# EasyEDA Pro project ProPrj_zuizhong2.epro, board PCB1
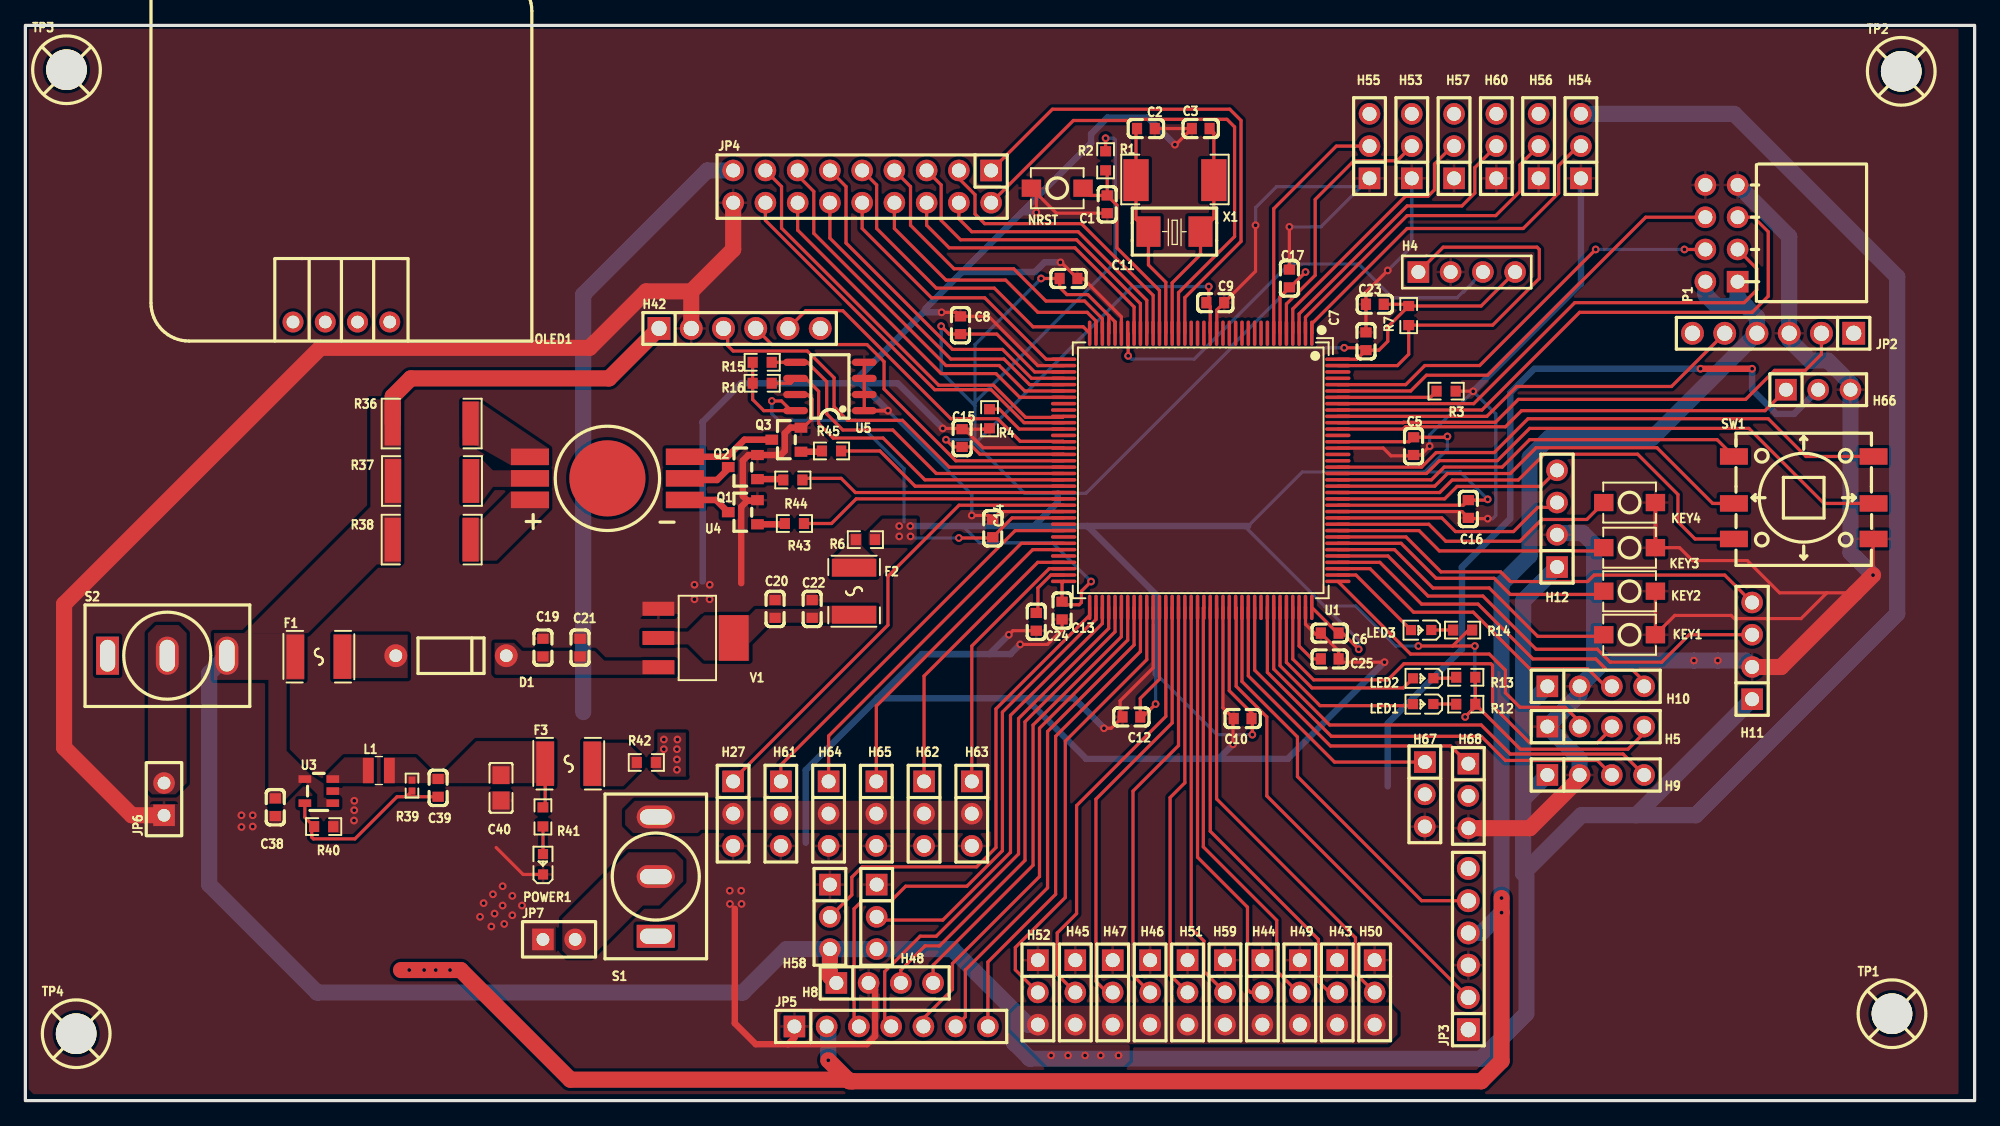
[diagram p1: board, top side]
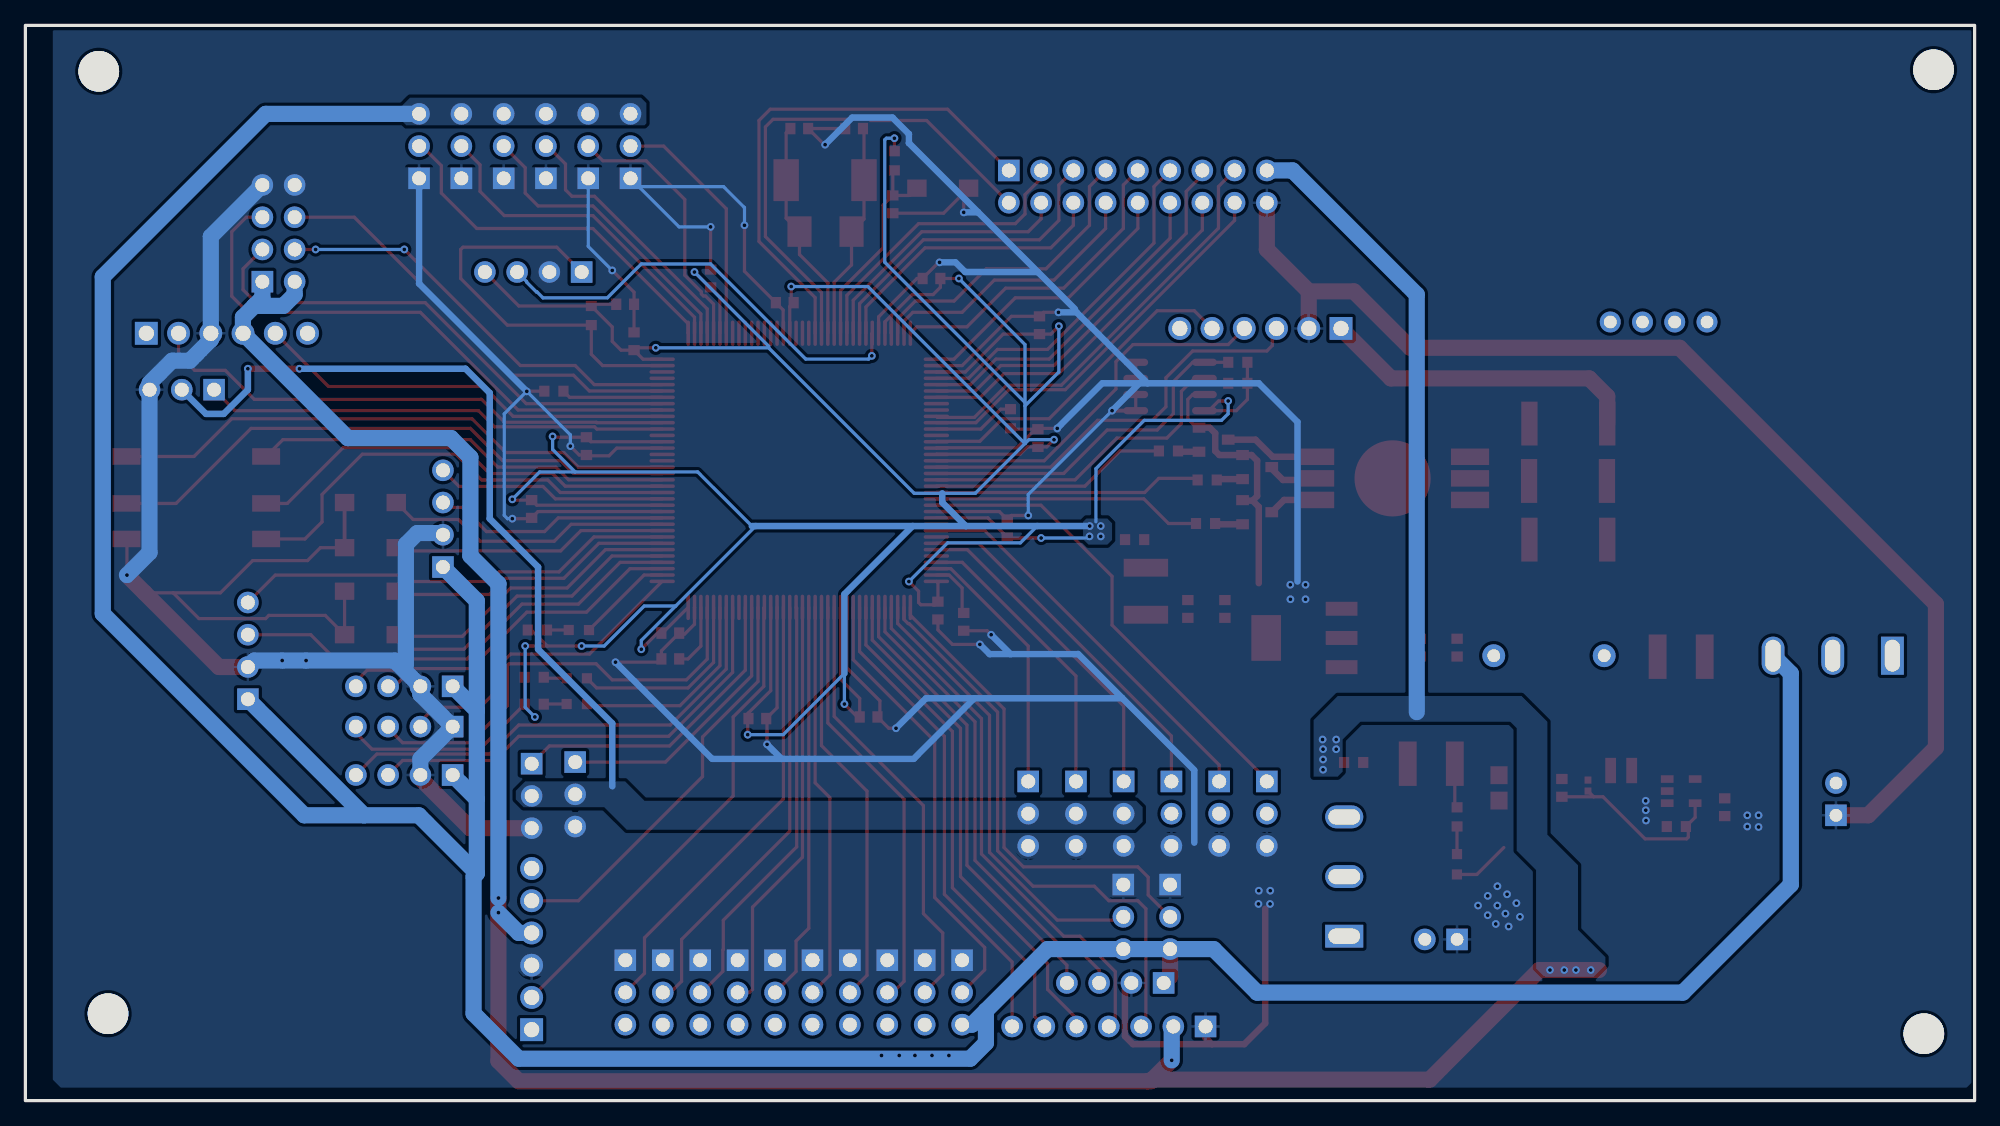
[diagram p2: board, bottom side, seen from below]

Outline 153.54 x 84.71 mm; copper layers: Top Layer, Bottom Layer. Coordinates in mm from the lower left corner of the outline.
Outline path: rectangle 0,84.71 153.54,0
Stack: Top Layer 0.035mm / Dielectric1 1.51mm FR4 er 4.5 / Bottom Layer 0.035mm

## Design rules (mm)
template: JLCPCB Capability(Two Layers Board)
spacing copperThickness1oz (default): track to track 0.102, other pairs 0.152 to 0.3
spacing copperThickness2oz: track to track 0.203, other pairs 0.152 to 0.3
track width copperThickness1oz (default): min 0.127, default 0.254, max 2.54
track width copperThickness2oz: min 0.203, default 0.254, max 2.54
differential pair differentialPair (default): width min 0.127, default 0.254, max 2.54; gap min 0.152, default 0.152
via viaSize (default): diameter min 0.5, default 0.61, max 10; hole min 0.3, default 0.305, max 6.3

## Placement (name value [footprint] x y rotation side)
C1  104  [C0603]  85.22 70.61 90 top
C2  22pF  [C0603]  88.26 76.58 180 top
C3  22pF  [C0603]  92.58 76.58 0 top
C5  104  [C0603]  109.35 51.56 90 top
C6  104  [C0603]  102.74 36.83 0 top
C7  104  [C0603]  105.6 59.82 270 top
C8  104  [C0603]  73.66 61.09 270 top
C9  104  [C0603]  93.73 62.87 180 top
C10  104  [C0603]  95.88 30.1 0 top
C11  104  [C0603]  82.17 64.77 180 top
C12  104  [C0603]  87.12 30.23 0 top
C13  104  [C0603]  81.66 38.61 90 top
C14  104  [C0603]  76.2 45.09 270 top
C15  104  [C0603]  73.79 52.2 270 top
C16  104  [C0603]  113.66 46.61 90 top
C17  104  [C0603]  99.57 64.77 270 top
C19  100nF  [C0603]  40.77 35.69 270 top
C20  100nF  [C0603]  59.06 38.74 270 top
C21  10uF  [C0603]  43.69 35.69 270 top
C22  10uF  [C0603]  61.98 38.74 270 top
C23  104  [C0603]  106.3 62.74 0 top
C24  225  [C0603]  79.63 37.72 90 top
C25  225  [C0603]  102.74 34.8 180 top
C38  10uF  [C0603]  19.69 23.11 90 top
C39  22pF  [C0603]  32.51 24.64 90 top
C40  22uF  [C0805]  37.47 24.64 90 top
D1  -  [DO_1N4007]  33.53 35.05 180 top
F1  FUSE 500mA  [F1812]  23.11 34.97 0 top
F2  FUSE 500mA  [F1812]  65.28 40.13 90 top
F3  FUSE 500mA  [F1812]  42.8 26.54 0 top
H4  PZ254V-11-04P  [HDR-TH_4P-P2.54-V-M-1]  113.54 65.28 0 top
H5  PZ254V-11-04P  [HDR-TH_4P-P2.54-V-M]  123.7 29.46 0 top
H8  PZ254V-11-04P  [HDR-TH_4P-P2.54-V-M]  67.69 9.27 0 top
H9  PZ254V-11-04P  [HDR-TH_4P-P2.54-V-M]  123.7 25.65 0 top
H10  PZ254V-11-04P  [HDR-TH_4P-P2.54-V-M]  123.7 32.64 0 top
H11  PZ254V-11-04P  [HDR-TH_4P-P2.54-V-M]  136.02 35.43 90 top
H12  PZ254V-11-04P  [HDR-TH_4P-P2.54-V-M]  120.65 45.85 90 top
H27  PZ254V-11-03P  [HDR-TH_3P-P2.54-V-M]  55.75 22.61 270 top
H42  PZ254V-11-06P  [HDR-TH_6P-P2.54-V-M-1]  56.26 60.83 0 top
H43  PZ254V-11-03P  [HDR-TH_3P-P2.54-V-M]  103.34 8.52 270 top
H44  PZ254V-11-03P  [HDR-TH_3P-P2.54-V-M]  97.44 8.52 270 top
H45  PZ254V-11-03P  [HDR-TH_3P-P2.54-V-M]  82.7 8.52 270 top
H46  PZ254V-11-03P  [HDR-TH_3P-P2.54-V-M]  88.6 8.52 270 top
H47  PZ254V-11-03P  [HDR-TH_3P-P2.54-V-M]  85.65 8.52 270 top
H48  PZ254V-11-03P  [HDR-TH_3P-P2.54-V-M]  67.06 14.48 270 top
H49  PZ254V-11-03P  [HDR-TH_3P-P2.54-V-M]  100.39 8.52 270 top
H50  PZ254V-11-03P  [HDR-TH_3P-P2.54-V-M]  106.28 8.52 270 top
H51  PZ254V-11-03P  [HDR-TH_3P-P2.54-V-M]  91.54 8.52 270 top
H52  PZ254V-11-03P  [HDR-TH_3P-P2.54-V-M]  79.76 8.52 270 top
H53  PZ254V-11-03P  [HDR-TH_3P-P2.54-V-M]  109.21 75.2 90 top
H54  PZ254V-11-03P  [HDR-TH_3P-P2.54-V-M]  122.53 75.2 90 top
H55  PZ254V-11-03P  [HDR-TH_3P-P2.54-V-M]  105.88 75.2 90 top
H56  PZ254V-11-03P  [HDR-TH_3P-P2.54-V-M]  119.2 75.2 90 top
H57  PZ254V-11-03P  [HDR-TH_3P-P2.54-V-M]  112.54 75.2 90 top
H58  PZ254V-11-03P  [HDR-TH_3P-P2.54-V-M]  63.37 14.48 270 top
H59  PZ254V-11-03P  [HDR-TH_3P-P2.54-V-M]  94.49 8.52 270 top
H60  PZ254V-11-03P  [HDR-TH_3P-P2.54-V-M]  115.87 75.2 90 top
H61  PZ254V-11-03P  [HDR-TH_3P-P2.54-V-M]  59.51 22.61 270 top
H62  PZ254V-11-03P  [HDR-TH_3P-P2.54-V-M]  70.79 22.61 270 top
H63  PZ254V-11-03P  [HDR-TH_3P-P2.54-V-M]  74.55 22.61 270 top
H64  PZ254V-11-03P  [HDR-TH_3P-P2.54-V-M]  63.27 22.61 270 top
H65  PZ254V-11-03P  [HDR-TH_3P-P2.54-V-M]  67.03 22.61 270 top
H66  PZ254V-11-03P  [HDR-TH_3P-P2.54-V-M]  141.22 56.01 0 top
H67  PZ254V-11-03P  [HDR-TH_3P-P2.54-V-M]  110.24 24.13 270 top
H68  PZ254V-11-03P  [HDR-TH_3P-P2.54-V-M]  113.66 24 270 top
JP2  PZ254V-11-06P  [HDR-TH_6P-P2.54-V-M-1]  137.67 60.45 180 top
JP3  PZ254V-11-06P  [HDR-TH_6P-P2.54-V-M-1]  113.66 11.94 90 top
JP4  PZ254V-12-18P  [HDR-TH_18P-P2.54-V-M-R2-C9-S2.54]  65.91 72.01 180 top
JP5  PM254V-11-07-H85  [HDR-TH_7P-P2.54-V-M-1]  68.2 5.84 0 top
JP6  -  [HDR-TH_2P-P2.54-V-F]  10.92 23.75 90 top
JP7  -  [HDR-TH_2P-P2.54-V-F]  42.04 12.7 0 top
KEY1  K2-3.6×6.1_SMD  [Key_SMD_3x4x2]  126.37 36.7 0 top
KEY2  K2-3.6×6.1_SMD  [Key_SMD_3x4x2]  126.37 40.13 0 top
KEY3  K2-3.6×6.1_SMD  [Key_SMD_3x4x2]  126.37 43.56 0 top
KEY4  K2-3.6×6.1_SMD  [Key_SMD_3x4x2]  126.37 47.12 0 top
L1  4.7uH  [IND-SMD_L2.5-W2.0-VLS252012CX-150M]  27.84 26 0 top
LED1  LED-0603_R  [LED0603-RD_WHITE]  110.11 31.24 180 top
LED2  LED-0603_R  [LED0603-RD_WHITE]  110.11 33.27 180 top
LED3  LED-0603_R  [LED0603-RD_WHITE]  109.95 37.07 180 top
NRST  K2-3.6×6.1_SMD  [Key_SMD_3x4x2]  81.28 71.88 180 top
OLED1  -  [0.96OLED_4P]  24.89 61.34 180 top
P1  PM254-2-04-W-8.5  [HDR-TH_8P-P2.54-H-F-R2-C4-W8.5]  133.6 68.33 90 top
POWER1  -  [LED_0603]  40.77 18.67 90 top
Q1  -  [S8050_SOT-23]  56.52 46.23 0 top
Q2  -  [S8050_SOT-23]  56.52 49.78 0 top
Q3  -  [S8050_SOT-23]  59.94 51.94 0 top
R1  1mΩ  [RES-SMD_L6.4-W3.2-R2512]  90.55 72.52 0 top
R2  10kΩ  [R0603_NEW]  85.09 74.04 90 top
R3  10kΩ  [R0603_NEW]  111.91 55.89 180 top
R4  10kΩ  [R0603_NEW]  75.95 53.72 90 top
R6  0Ω  [R0603]  66.17 44.2 0 top
R7  10kΩ  [R0603_NEW]  108.97 61.85 90 top
R12  510Ω  [R0603_NEW]  113.46 31.23 180 top
R13  510Ω  [R0603_NEW]  113.46 33.35 180 top
R14  510Ω  [R0603_NEW]  113.21 37.07 180 top
R15  10kΩ  [R0603_NEW]  58.04 58.17 0 top
R16  10kΩ  [R0603_NEW]  58.04 56.52 0 top
R36  10Ω  [R2512]  32 53.34 0 top
R37  5Ω  [R2512]  32.03 48.82 0 top
R38  5Ω  [R2512]  32 44.2 0 top
R39  453kΩ  [R0402]  30.45 24.82 90 top
R40  100kΩ  [R0603]  23.5 21.59 180 top
R41  1kΩ  [R0603]  40.77 22.35 90 top
R42  0Ω  [R0603]  48.91 26.64 0 top
R43  510Ω  [R0603_NEW]  60.58 45.47 180 top
R44  510Ω  [R0603_NEW]  60.45 48.9 180 top
R45  510Ω  [R0603_NEW]  63.5 51.18 180 top
S1  MT-0-102-A101-M200-RS  [SW-TH_MT-0-103-A101-M200-RS]  49.66 17.65 90 top
S2  MT-0-102-A101-M200-RS  [SW-TH_MT-0-103-A101-M200-RS]  11.18 35.05 0 top
SW1  TM-2027  [SW-SMD_6P-P2.80-L10.2-W10.2]  140.08 47.5 0 top
TP1  -  [M3螺丝]  147.1 6.78 0 top
TP2  -  [M3螺丝]  147.83 81.03 0 top
TP3  -  [M3螺丝]  3.3 81.15 0 top
TP4  -  [M3螺丝]  4.06 5.21 0 top
U1  STM32F407ZGT6 COPY  [LQFP-144_L20.0-W20.0-P0.50-LS22.0-BL]  92.58 49.66 180 top
U3  PW2053  [SOT-23-5_L2.9-W1.6-P0.95-LS2.8-BL]  23.11 24.38 90 top
U4  XL-HD6070RGBC-A46L-BD  [LED-SMD_6P-BD8.0-LS14.5]  45.85 49.02 180 top
U5  24C02/TR  [SOIC-8_L5.0-W4.0-P1.27-LS6.0-BL]  63.37 56.26 90 top
V1  AMS1117-3.3  [SOT-223-3_L6.5-W3.4-P2.30-LS7.0-BR]  52.83 36.45 180 top
X1  8MHz  [OSC-SMD_L5.0-W3.2]  90.52 68.46 0 top

## Footprints (pads in the part's own frame, mm; a bottom-side part is the same pattern mirrored in y, then rotated)
0.96OLED_4P
  round 1.65 hole 1: 1(-3.81,-0.002) 2(-1.27,0.002) 3(1.27,0.002) 4(3.81,0.002)
C0603
  rect 0.8x0.9 smd: 1(-0.7,0) 2(0.7,0)
C0805
  rect 1.41x1.35 smd: 1(-1,0) 2(1,0)
DO_1N4007
  round 1.8 hole 1: 1(-4.35,0) 2(4.35,0)
F1812
  rect 1.407x3.499 smd: 1(-1.853,0) 2(1.853,0)
HDR-TH_2P-P2.54-V-F
  rect 1.7x1.7 hole 1: 1(-1.27,0)
  round 1.7 hole 1: 2(1.27,0)
HDR-TH_3P-P2.54-V-M
  rect 1.7x1.7 hole 1.1: 1(-2.54,0)
  round 1.7 hole 1.1: 2(0,0) 3(2.54,0)
HDR-TH_4P-P2.54-V-M
  rect 1.7x1.7 hole 1.1: 1(-3.81,0)
  round 1.7 hole 1.1: 2(-1.27,0) 3(1.27,0) 4(3.81,0)
HDR-TH_4P-P2.54-V-M-1
  rect 1.7x1.7 hole 1.1: 1(-3.81,0)
  round 1.7 hole 1.1: 2(-1.27,0) 3(1.27,0) 4(3.81,0)
HDR-TH_6P-P2.54-V-M-1
  rect 1.8x1.8 hole 1.2: 1(-6.35,0)
  round 1.8 hole 1.2: 2(-3.81,0) 3(-1.27,0) 4(1.27,0) 5(3.81,0) 6(6.35,0)
HDR-TH_7P-P2.54-V-M-1
  rect 1.7x1.7 hole 1.1: 1(-7.62,0)
  round 1.7 hole 1.1: 2(-5.08,0) 3(-2.54,0) 4(0,0) 5(2.54,0) 6(5.08,0) 7(7.62,0)
HDR-TH_8P-P2.54-H-F-R2-C4-W8.5
  rect 1.7x1.7 hole 1.1: 1(-3.81,-1.27)
  round 1.7 hole 1.1: 2(-3.81,1.27) 3(-1.27,-1.27) 4(-1.27,1.27) 5(1.27,-1.27) 6(1.27,1.27) 7(3.81,-1.27) 8(3.81,1.27)
HDR-TH_18P-P2.54-V-M-R2-C9-S2.54
  rect 1.7x1.7 hole 1.1: 1(-10.16,-1.27)
  round 1.7 hole 1.1: 2(-10.16,1.27) 3(-7.62,-1.27) 4(-7.62,1.27) 5(-5.08,-1.27) 6(-5.08,1.27) 7(-2.54,-1.27) 8(-2.54,1.27) 9(0,-1.27) 10(0,1.27) 11(2.54,-1.27) 12(2.54,1.27) 13(5.08,-1.27) 14(5.08,1.27) 15(7.62,-1.27) 16(7.62,1.27) 17(10.16,-1.27) 18(10.16,1.27)
IND-SMD_L2.5-W2.0-VLS252012CX-150M
  rect 0.85x2 smd: 1(-0.83,0) 2(0.83,0)
Key_SMD_3x4x2
  rect 1.53x1.36 smd: 1(-2.035,0) 2(2.035,0)
LED0603-RD_WHITE
  rect 0.8x0.8 smd: 1(-0.799,-0.004) 2(0.799,0.004)
LED-SMD_6P-BD8.0-LS14.5
  rect 3x1.3 smd: 1(6.1,1.7) 2(-6.1,1.7) 3(6.1,0) 4(-6.1,0) 5(6.1,-1.7) 6(-6.1,-1.7)
  round 6 smd: 7(0,0)
LED_0603
  rect 0.8x0.8 smd: 1(-0.851,-0.01) 2(0.75,-0.005)
LQFP-144_L20.0-W20.0-P0.50-LS22.0-BL
  oval 0.28x2 smd: 1(-8.75,-10.8) 2(-8.25,-10.8) 3(-7.75,-10.8) 4(-7.25,-10.8) 5(-6.75,-10.8) 6(-6.25,-10.8) 7(-5.75,-10.8) 8(-5.25,-10.8) 9(-4.75,-10.8) 10(-4.25,-10.8) 11(-3.75,-10.8) 12(-3.25,-10.8) 13(-2.75,-10.8) 14(-2.25,-10.8) 15(-1.75,-10.8) 16(-1.25,-10.8) 17(-0.75,-10.8) 18(-0.25,-10.8) 19(0.25,-10.8) 20(0.75,-10.8) 21(1.25,-10.8) 22(1.75,-10.8) 23(2.25,-10.8) 24(2.75,-10.8) 25(3.25,-10.8) 26(3.75,-10.8) 27(4.25,-10.8) 28(4.75,-10.8) 29(5.25,-10.8) 30(5.75,-10.8) 31(6.25,-10.8) 32(6.75,-10.8) 33(7.25,-10.8) 34(7.75,-10.8) 35(8.25,-10.8) 36(8.75,-10.8) 73(8.75,10.8) 74(8.25,10.8) 75(7.75,10.8) 76(7.25,10.8) 77(6.75,10.8) 78(6.25,10.8) 79(5.75,10.8) 80(5.25,10.8) 81(4.75,10.8) 82(4.25,10.8) 83(3.75,10.8) 84(3.25,10.8) 85(2.75,10.8) 86(2.25,10.8) 87(1.75,10.8) 88(1.25,10.8) 89(0.75,10.8) 90(0.25,10.8) 91(-0.25,10.8) 92(-0.75,10.8) 93(-1.25,10.8) 94(-1.75,10.8) 95(-2.25,10.8) 96(-2.75,10.8) 97(-3.25,10.8) 98(-3.75,10.8) 99(-4.25,10.8) 100(-4.75,10.8) 101(-5.25,10.8) 102(-5.75,10.8) 103(-6.25,10.8) 104(-6.75,10.8) 105(-7.25,10.8) 106(-7.75,10.8) 107(-8.25,10.8) 108(-8.75,10.8)
  oval 2x0.28 smd: 37(10.8,-8.75) 38(10.8,-8.25) 39(10.8,-7.75) 40(10.8,-7.25) 41(10.8,-6.75) 42(10.8,-6.25) 43(10.8,-5.75) 44(10.8,-5.25) 45(10.8,-4.75) 46(10.8,-4.25) 47(10.8,-3.75) 48(10.8,-3.25) 49(10.8,-2.75) 50(10.8,-2.25) 51(10.8,-1.75) 52(10.8,-1.25) 53(10.8,-0.75) 54(10.8,-0.25) 55(10.8,0.25) 56(10.8,0.75) 57(10.8,1.25) 58(10.8,1.75) 59(10.8,2.25) 60(10.8,2.75) 61(10.8,3.25) 62(10.8,3.75) 63(10.8,4.25) 64(10.8,4.75) 65(10.8,5.25) 66(10.8,5.75) 67(10.8,6.25) 68(10.8,6.75) 69(10.8,7.25) 70(10.8,7.75) 71(10.8,8.25) 72(10.8,8.75) 109(-10.8,8.75) 110(-10.8,8.25) 111(-10.8,7.75) 112(-10.8,7.25) 113(-10.8,6.75) 114(-10.8,6.25) 115(-10.8,5.75) 116(-10.8,5.25) 117(-10.8,4.75) 118(-10.8,4.25) 119(-10.8,3.75) 120(-10.8,3.25) 121(-10.8,2.75) 122(-10.8,2.25) 123(-10.8,1.75) 124(-10.8,1.25) 125(-10.8,0.75) 126(-10.8,0.25) 127(-10.8,-0.25) 128(-10.8,-0.75) 129(-10.8,-1.25) 130(-10.8,-1.75) 131(-10.8,-2.25) 132(-10.8,-2.75) 133(-10.8,-3.25) 134(-10.8,-3.75) 135(-10.8,-4.25) 136(-10.8,-4.75) 137(-10.8,-5.25) 138(-10.8,-5.75) 139(-10.8,-6.25) 140(-10.8,-6.75) 141(-10.8,-7.25) 142(-10.8,-7.75) 143(-10.8,-8.25) 144(-10.8,-8.75)
M3螺丝
  round 3.2 hole 3.2: 1(-0.064,0.064)
OSC-SMD_L5.0-W3.2
  rect 1.9x2.4 smd: 1(-2.05,0) 2(2.05,0)
R0402
  rect 0.566x0.54 smd: 1(-0.433,0) 2(0.433,0)
R0603
  rect 0.806x0.864 smd: 1(-0.753,0) 2(0.753,0)
R0603_NEW
  rect 0.806x0.864 smd: 1(-0.753,0) 2(0.753,0)
R2512
  rect 1.282x3.456 smd: 1(-3.067,0) 2(3.067,0)
RES-SMD_L6.4-W3.2-R2512
  rect 2x3.3 smd: 1(-3.067,0) 2(3.067,0)
S8050_SOT-23
  rect 1x0.8 smd: 1(1.15,-0.823) 2(1.15,1.077) 3(-1.15,0.127)
SOIC-8_L5.0-W4.0-P1.27-LS6.0-BL
  oval 0.569x1.95 smd: 1(-1.905,-2.705) 2(-0.635,-2.705) 3(0.635,-2.705) 4(1.905,-2.705) 5(1.905,2.705) 6(0.635,2.705) 7(-0.635,2.705) 8(-1.905,2.705)
SOT-23-5_L2.9-W1.6-P0.95-LS2.8-BL
  rect 0.6x1 smd: 1(-0.95,-1.1) 2(0,-1.1) 3(0.95,-1.1) 4(0.95,1.1) 5(-0.95,1.1)
SOT-223-3_L6.5-W3.4-P2.30-LS7.0-BR
  rect 2.5x1.1 smd: 1(2.97,-2.3) 2(2.97,0) 3(2.97,2.3)
  rect 2.34x3.6 smd: 4(-2.97,0)
SW-SMD_6P-P2.80-L10.2-W10.2
  rect 2.2x1.3 smd: 1(-5.5,3.25) 2(-5.5,-0.45) 3(-5.5,-3.25) 4(5.5,-3.25) 5(5.5,-0.45) 6(5.5,3.25)
SW-TH_MT-0-103-A101-M200-RS
  rect 1.8x3 hole 1.2x2.5: 1(-4.7,0)
  oval 1.8x3 hole 1.2x2.5: 2(0,0) 3(4.7,0)

## Nets
As in the schematic.

Pads without a net: H42 6; JP2 1 6; JP3 1 6; OLED1 1 2 3 4; S1 1; S2 1; TP1 1; TP2 1; TP3 1; TP4 1; U4 7

## Via types
v1: diameter 0.61, hole 0.305, Top Layer to Bottom Layer, 92 vias

## Routing (per net, layer and track width the routed paths; a pad name or vN(x,y) marks a point on that pad's centre or on a via; arc(x,y) is an arc through that point)
5V: length 313.8
  Top Layer w1.27: R36.1 28.94,55.48 30.35,56.9 45.97,56.9 H42.1 ; H8.1 63.37,9.78 H58.3
  Bottom Layer w1.27: 126.87,22.48 H11.1 ; 126.87,22.48 131.57,22.48 147.45,38.35 147.45,64.9 134.61,77.74 H54.3 ; 126.87,22.48 122.56,22.48 117.98,17.91 ; H12.1 117.98,39.37 117.98,30.73 ; 117.98,17.91 117.98,23.75 ; 117.98,17.91 118.24,17.65 118.24,6.86 114.68,3.3 79.12,3.3 77.88,4.54 77.88,7.08 ; 117.98,23.75 H9.1 ; 117.98,23.75 117.98,30.73 ; S2.3 14.48,33.65 14.48,17.02 22.99,8.51 56.52,8.51 59.94,11.94 H58.3 H48.3 73.03,11.94 77.88,7.08 ; 77.88,7.08 78.98,5.98 H52.3 ; 117.98,30.73 H10.1
  vias: v1(80.8,3.56) v1(82.13,3.56) v1(83.47,3.56) v1(84.71,3.56) v1(86.11,3.56)
GND: length 660
  Top Layer w0.254: U1.83 88.83,34.1 86.23,31.5 86.23,30.42 C12.1 85.53,29.34 v1(84.96,29.34) ; R3.1 114.03,55.89 v1(114.05,55.88) ; 105.6,62.74 105.6,63.69 v1(107.31,65.41) ; R4.1 75.88,52.9 73.98,52.9 75.44,51.44 81.75,51.44 U1.51 ; v1(90.55,75.31) 90.61,75.31 C3.1 88.97,76.58 ; U5.4 U5.3 U5.2 U5.1 ; 79.63,71.5 NRST.2 ; 79.63,71.5 v1(79.63,69.98) ; 79.63,71.5 81.22,69.91 C1.1 ; U1.16 93.85,60.48 93.85,62.29 C9.1 96.9,65.34 v1(96.9,68.96) ; v1(145.54,41.4) 145.54,44.21 SW1.4 ; 105.6,60.52 C23.1 ; Q3.2 61.28,53.02 61.98,53.72 61.98,55.25 61.59,55.63 U5.7 ; C24.1 77.79,37.02 v1(77.47,36.7) ; v1(115.19,45.85) 113.73,45.85 C16.1 113.17,46.41 U1.120 ; 37.08,19.94 39.2,17.82 POWER1.1 ; v1(81.53,66.04) 81.6,66.04 C11.1 83.31,64.77 86.33,61.75 U1.31 ; KEY3.2 130.3,43.56 131.32,42.55 135.64,42.55 138.18,40.01 141.9,40.01 ; v1(99.57,68.83) C17.1 ; 81.66,37.91 81.66,37.08 80.52,35.94 v1(78.36,35.94) ; v1(72.26,52.96) 73.72,52.96 C15.1 ; v1(110.62,51.56) 109.92,50.86 C5.1 109.28,50.8 107.57,50.8 106.96,51.41 U1.130 ; v1(107.06,34.54) 103.7,34.54 C25.1 103.44,35.43 C6.1 101.97,36.76 101.61,36.76 100.84,37.53 100.84,38.85 U1.107 ; v1(95.12,28.07) 95.12,30.04 C10.1 94.33,30.95 U1.94 ; v1(74.55,46.1) 75.88,46.1 C14.1 76.82,46.41 U1.61 ; 141.9,40.01 144.15,40.01 ; 141.9,40.01 139.87,37.97 134.62,37.97 134.37,38.23 129.92,38.23 KEY1.2 KEY2.2 ; U1.38 79.76,57.91 75.88,61.79 C8.1 73.34,62.1 v1(72.17,62.1)
  Top Layer w0.305: v1(67.94,54.36) U5.1 ; KEY4.2 KEY3.2
  Top Layer w0.508: H8.2 66.93,8.76 66.93,5.08 66.29,4.45 60.07,4.45 ; Q1.2 57.63,47.27 56.87,47.27 ; 56.87,47.27 56.39,46.78 56.39,40.77 ; 56.87,47.27 56.52,47.63 56.52,50.42 56.96,50.86 Q2.2 59.5,50.86 59.82,51.18 59.82,52.58 60.26,53.02 Q3.2 ; 60.07,4.45 60.58,4.95 JP5.1 ; 60.07,4.45 57.53,4.45 55.88,6.1 55.88,15.11
  Top Layer w1.27: H42.2 52.45,63.75 ; 52.45,63.75 48.89,63.75 44.45,59.31 23.24,59.31 3.05,39.12 3.05,27.81 8.38,22.48 JP6.1 ; 52.45,63.75 55.75,67.06 JP4.18 ; H9.2 122.43,25.38 118.51,21.46 H68.3 ; H11.2 138.3,34.16 v1(145.54,41.4)
  Bottom Layer w0.254: v1(67.94,54.36) 74.55,47.75 v1(74.55,46.1) ; v1(110.62,51.56) 110.62,52.45 v1(114.05,55.88) 115.82,54.1 115.82,46.1 115.57,45.85 v1(115.19,45.85) ; 105.23,72.01 98.55,72.01 96.9,70.36 v1(96.9,68.96) ; 105.23,72.01 102.05,68.83 v1(99.57,68.83) ; 105.23,72.01 H55.1 ; H53.1 109.21,67.3 v1(107.31,65.41)
  Bottom Layer w0.508: 65.15,56.52 70.74,62.1 v1(72.17,62.1) ; 65.15,56.52 65.79,56.52 ; 65.15,56.52 56.39,56.52 53.34,53.47 53.34,40.89 ; 78.79,31.7 67.13,31.7 ; 78.79,31.7 82.6,31.7 v1(84.96,29.34) ; 78.79,31.7 83.57,26.92 93.98,26.92 ; 67.13,31.7 61.47,26.04 61.47,20.32 ; 67.13,31.7 70.61,35.18 75.95,35.18 ; v1(72.26,52.96) 68.71,56.52 65.79,56.52 ; 93.98,26.92 99.44,26.92 v1(107.06,34.54) ; 93.98,26.92 v1(95.12,28.07) ; 65.79,56.52 v1(67.94,54.36) ; 78.49,69.98 83.95,75.44 83.95,76.16 85.24,77.45 88.41,77.45 v1(90.55,75.31) ; 78.49,69.98 73.79,65.28 ; 78.49,69.98 v1(79.63,69.98) ; 75.95,35.18 v1(77.47,36.7) ; 75.95,35.18 77.6,35.18 v1(78.36,35.94) ; 70.87,62.36 73.79,65.28 ; 73.79,65.28 79.51,65.28 80.27,66.04 v1(81.53,66.04) ; H54.1 122.53,64.37 v1(114.05,55.88)
  Bottom Layer w1.27: v1(145.54,41.4) 143.76,43.18 H66.3 143.76,56.52 141.99,58.29 140.59,58.29 138.94,59.94 JP2.3 138.94,68.07 P1.7 ; 123.57,34.29 123.57,43.82 122.67,44.71 120.79,44.71 H12.2 ; H9.2 122.43,26.92 H5.1 122.43,32 H10.2 124.46,34.67 v1(131.43,34.67) v1(133.32,34.67) 135.51,34.67 H11.2
  vias: v1(17.02,22.48) v1(17.02,21.56) v1(17.91,22.48) v1(17.91,21.59) v1(25.89,22.06) v1(25.91,23.62) v1(25.9,22.88) v1(35.81,14.48) v1(36.1,15.56) v1(36.7,13.72) v1(36.83,16.26) v1(36.96,14.73) v1(37.59,16.89) v1(37.59,15.37) v1(37.72,13.92) v1(38.35,16.13) v1(38.35,14.61) v1(39.12,15.37) v1(52.7,40.64) v1(52.7,39.5) v1(53.91,40.64) v1(53.9,39.5) v1(55.48,16.54) v1(55.5,15.49) v1(56.39,16.54) v1(56.41,15.49)
VDD: length 228
  Top Layer w1.27: 65.15,1.52 64.9,1.52 64.77,1.65 ; 65.15,1.52 114.68,1.52 116.28,3.12 v1(116.28,14.81) v1(116.28,15.96) ; 65.15,1.52 64.77,1.65 ; 29.59,10.29 v1(30.24,10.29) v1(31.41,10.29) v1(32.33,10.29) v1(33.45,10.29) 34.29,10.29 42.93,1.65 64.77,1.65 ; 64.77,1.65 v1(63.25,3.18)
  Bottom Layer w1.27: 135.51,62.61 136.41,61.71 136.41,60.45 ; 135.51,62.61 133.22,62.61 132.33,63.5 P1.2 ; 135.51,62.61 134.87,63.25 P1.1 ; JP4.17 53.72,73.28 43.94,63.5 43.94,30.61 ; JP5.2 63.25,5.72 v1(63.25,3.18) ; JP2.4 128.14,52.2 120.01,52.2 118.49,50.67 118.49,42.93 116.28,40.72 v1(116.28,15.96) ; v1(116.28,14.81) 114.68,13.21 JP3.4
  vias: v1(50.29,28.45) v1(50.29,27.69) v1(51.36,28.45) v1(51.33,27.69) v1(51.33,26.88) v1(51.33,26.07)
VDD3.3: length 419.7
  Top Layer w0.254: v1(96.65,28.83) 96.65,30.48 96.59,30.54 ; U1.39 81.78,57.4 79.5,57.4 76.52,60.39 C8.2 72.76,60.39 v1(72.14,61.01) ; v1(72.52,52.07) 73.09,51.5 C15.2 74.61,51.5 75.18,50.93 81.76,50.93 U1.52 ; 60.32,54.36 58.17,54.36 57.29,55.24 R16.1 R15.1 ; 60.32,54.36 U5.8 ; 60.32,54.36 59.56,55.12 v1(58.8,55.12) ; v1(113.41,30.23) 114.22,31.03 R12.1 ; U1.84 89.33,33.2 87.82,31.69 C12.2 88.01,30.23 v1(89.03,31.24) ; R12.1 R13.1 ; R12.1 117.76,27.69 126.24,27.69 127.51,28.96 H5.4 ; U1.121 113.26,46.91 C16.2 115.13,47.31 v1(115.19,47.37) ; H4.4 114.67,62.6 R7.2 ; U1.72 81.66,40.79 C13.2 81.91,39.06 83.01,39.06 83.19,39.24 83.19,40.13 v1(83.95,40.89) ; v1(105.03,35.56) 103.76,36.83 C6.2 103.36,36.83 U1.108 ; U1.144 104.88,58.41 C7.2 ; v1(80.01,64.77) C11.2 81.47,64.07 82.04,63.5 83.69,63.5 85.34,61.85 ; U1.33 85.34,60.47 85.34,61.85 ; 85.34,61.85 85.83,61.36 U1.32 ; U1.131 108.99,51.91 C5.2 111.95,52.26 v1(112.01,52.32) ; v1(93.22,64.14) 93.22,63.06 C9.2 93.33,62.56 U1.17 ; 96.59,30.54 94.83,32.29 U1.95 ; 96.59,30.54 96.59,30.1 ; R7.2 108.83,62.74 C23.2 ; R7.2 107.31,60.95 107.31,59.82 106.62,59.12 C7.2 ; C7.2 105.41,59.31 v1(103.89,59.31) ; v1(100.84,65.28) 99.63,64.07 C17.2 98.83,63.34 U1.6 ; 112.43,35.81 113.69,37.07 R14.1 ; 112.43,35.81 v1(109.73,35.81) ; 112.43,35.81 v1(114.17,35.81) ; v1(73.53,44.32) 76.14,44.32 C14.2 77.72,45.91 U1.62 ; R2.2 v1(85.09,75.82)
  Bottom Layer w0.254: v1(83.95,40.89) 80.9,43.94 75.16,43.94 73.84,45.27 ; 74.8,54.74 74.8,51.76 ; 74.8,54.74 72.14,57.4 v1(72.14,61.01) ; 74.8,54.74 74.8,55 ; 74.8,51.76 87.18,64.14 v1(93.22,64.14) ; 74.8,51.76 74.49,52.07 v1(72.52,52.07) ; 74.8,51.76 78.72,47.84 83.53,47.84 95,59.31 ; v1(85.09,75.82) 85.72,75.82 85.85,75.69 85.85,66.05 74.8,55 ; 74.8,55 74.8,59.56 v1(80.01,64.77) ; v1(58.8,55.12) 58.8,54.11 59.32,53.59 65.41,53.59 69.22,49.78 69.22,45.59 ; 95,59.31 95,59.44 v1(100.84,65.28) ; 95,59.31 v1(103.89,59.31) ; 96.32,45.27 100.58,49.53 110.24,49.53 ; 110.24,49.53 113.03,49.53 v1(115.19,47.37) ; 110.24,49.53 112.01,51.31 v1(112.01,52.32) ; 102.32,38.97 96.02,45.27 ; 102.32,38.97 105.03,36.26 v1(105.03,35.56) ; 102.32,38.97 104.8,38.97 107.95,35.81 v1(109.73,35.81) ; v1(113.41,30.23) 114.17,30.99 v1(114.17,35.81) ; v1(73.53,44.32) 69.85,44.32 v1(69.72,44.45) ; v1(89.03,31.24) 89.03,33.66 93.85,28.83 v1(96.65,28.83)
  Bottom Layer w0.508: 83.65,45.27 96.32,45.27 ; 83.65,45.27 89.03,39.89 89.03,33.66 ; 83.65,45.27 79.46,45.27 ; 79.46,45.27 v1(69.7,45.27) ; 79.46,45.27 81.32,47.12 81.32,47.84
  vias: v1(68.83,45.27) v1(68.83,44.45)
BOOT0: length 8
  Top Layer w0.254: U1.138 110.67,55.41 R3.2
BOOT1: length 6.5
  Top Layer w0.254: U1.48 78.28,52.91 76.72,54.47 R4.2
FB: length 15.1
  Top Layer w0.254: R39.1 30.01,23.94 ; 30.01,23.94 C39.1 ; 30.01,23.94 29.27,23.94 25.95,20.62 22.69,20.62 22.55,20.75 22.55,21.4 R40.2 22.01,22.32 U3.5
NRST: length 16.7
  Top Layer w0.254: C1.2 83.88,71.31 NRST.1 ; C1.2 85.98,70.55 85.98,67.18 89.33,63.83 U1.25 ; C1.2 85.22,73.16 R2.1
OSC_IN: length 17.6
  Top Layer w0.254: U1.23 90.33,64.43 92.57,66.66 X1.2 93.62,69.52 R1.2 93.62,76.25 C3.2
OSC_OUT: length 17.1
  Top Layer w0.254: U1.24 89.83,64.47 88.47,65.84 X1.1 87.48,69.45 R1.1 87.48,76.5 C2.2
P30: length 34.9
  Top Layer w0.254: v1(86.87,58.67) 86.87,60.42 U1.30
  Bottom Layer w0.254: v1(86.87,58.67) 87.12,58.42 92.07,58.42 99.57,65.91 105.03,65.91 107.7,63.25 112.78,63.25 113.24,63.71 113.29,63.71 114.06,64.48 114.06,64.53 H4.3
PA0: length 24.1
  Top Layer w0.254: U1.34 84.83,61.6 83.44,62.99 80.39,62.99 77.85,65.53 73.15,65.53 69.72,68.96 69.72,72.01 JP4.7
PA1: length 21.9
  Top Layer w0.254: U1.35 84.33,61.41 83.64,62.1 79.76,62.1 77.22,64.64 72.52,64.64 68.45,68.71 JP4.8
PA2: length 25.2
  Top Layer w0.254: U1.36 83.33,60.96 79.38,60.96 76.33,64.01 71.75,64.01 67.06,68.71 67.06,72.14 JP4.9
PA3: length 22.2
  Top Layer w0.254: JP4.10 65.91,68.71 71.37,63.25 75.56,63.25 80.4,58.41 U1.37
PA4: length 27.8
  Top Layer w0.254: JP4.11 64.64,72.01 64.64,67.56 73.03,59.18 76.97,59.18 79.25,56.91 U1.40
PA5: length 26
  Top Layer w0.254: U1.41 79.1,56.41 77.09,58.42 72.9,58.42 63.37,67.95 JP4.12
PA6: length 30.3
  Top Layer w0.254: U1.42 78.71,55.91 76.71,57.91 72.52,57.91 62.1,68.33 62.1,71.63 60.83,72.9 JP4.13
PA7: length 28.6
  Top Layer w0.254: U1.43 78.32,55.41 76.45,57.28 72.14,57.28 60.83,68.58 JP4.14
PA9: length 35.6
  Top Layer w0.254: U1.101 97.83,33.74 102.87,28.7 114.68,28.7 116.59,26.8 123.82,26.8 H9.3
PA10: length 37.5
  Top Layer w0.254: H9.4 125.86,27.31 116.97,27.31 114.68,29.59 102.74,29.59 98.33,34 U1.102
PA11: length 16.4
  Top Layer w0.254: U1.103 98.83,34.26 101.98,31.12 109.19,31.12 LED1.2
PA12: length 15.5
  Top Layer w0.254: U1.104 99.33,34.53 101.35,32.51 108.55,32.51 LED2.2
PA15: length 7.6
  Top Layer w0.254: LED3.2 104.81,41.41 U1.110
PB0: length 33.5
  Top Layer w0.254: JP4.15 59.56,72.01 59.56,68.74 71.94,56.36 76.25,56.36 78.79,53.83 81.7,53.83 U1.46
PB1: length 31.5
  Top Layer w0.254: JP4.16 58.29,69.34 71.63,56.01 76.07,56.01 78.67,53.41 U1.47
PB3: length 36.6
  Top Layer w0.254: U1.133 108.53,52.91 108.71,53.09 116.59,53.09 117.86,54.36 137.03,54.36 H66.1
PB4: length 42
  Top Layer w0.254: JP2.2 141.48,58.8 140.21,57.53 137.79,57.53 135.51,55.25 117.6,55.25 115.8,53.44 108.56,53.44 108.53,53.41 U1.134
PB5: length 33.2
  Top Layer w0.254: U1.135 115.12,53.91 117.47,56.26 129.67,56.26 JP2.5
PB6: length 45.6
  Top Layer w0.254: 134.87,69.6 136.14,69.6 137.29,68.45 137.29,63.37 136.02,62.1 122.43,62.1 114.73,54.41 U1.136
PB7: length 40.5
  Top Layer w0.254: U1.137 114.09,54.91 122.05,62.87 135.38,62.87 136.4,63.88 136.4,65.53 P1.3
PB8: length 34.6
  Top Layer w0.254: U1.139 109.12,55.91 110.36,57.15 115.19,57.15 127.63,69.6 132.33,69.6
PB9: length 33.4
  Top Layer w0.254: U1.140 108.73,56.41 110.24,57.91 114.55,57.91 v1(123.7,67.06) ; v1(130.68,67.06) P1.4
  Bottom Layer w0.254: v1(123.7,67.06) v1(130.68,67.06)
PB10: length 23
  Top Layer w0.254: H62.1 70.79,33.45 79.75,42.41 U1.69
PB11: length 20.4
  Top Layer w0.254: U1.70 80.64,41.91 74.55,35.81 H63.1
PB12: length 38.1
  Top Layer w0.254: H58.2 65.1,16.2 65.1,17.6 65.91,18.42 74.93,18.42 76.45,19.94 76.45,30.86 83.83,38.24 U1.73
PB13: length 45.3
  Top Layer w0.254: U1.74 84.33,37.9 84.01,37.58 83.93,37.58 76.96,30.61 76.96,19.69 74.17,16.89 69.34,16.89 68.2,15.75 65.91,15.75 65.28,15.11 65.28,6.22 65.66,5.84
PB14: length 35.2
  Top Layer w0.254: H48.2 67.31,14.22 72.26,14.22 77.6,19.56 77.6,30.35 84.83,37.59 U1.75
PB15: length 41.3
  Top Layer w0.254: U1.76 85.33,37.2 78.23,30.1 78.23,19.43 71.75,12.95 70.49,12.95 67.69,10.16 67.69,6.35 JP5.4
PC0: length 23.6
  Top Layer w0.254: JP4.3 73.53,72.64 74.8,71.37 74.8,69.85 75.56,69.09 83.19,69.09 88.83,63.44 U1.26
PC1: length 21.3
  Top Layer w0.254: JP4.4 73.53,69.47 74.55,68.45 82.93,68.45 88.33,63.05 U1.27
PC2: length 25.2
  Top Layer w0.254: U1.28 87.83,62.79 82.8,67.82 73.66,67.82 72.14,69.34 72.14,72.14 JP4.5
PC3: length 22.9
  Top Layer w0.254: JP4.6 70.99,68.96 72.77,67.18 82.68,67.18 87.33,62.53 U1.29
PC6: length 38.3
  Top Layer w0.254: JP3.2 97.79,24 97.79,30.23 95.38,32.64 95.38,38.81 U1.96
PC7: length 32.7
  Top Layer w0.254: JP3.5 109.98,15.75 100.2,25.53 100.2,28.65 95.83,33.02 U1.97
PC8: length 22.1
  Top Layer w0.254: H67.1 103.12,26.67 96.33,33.46 U1.98
PC9: length 24.8
  Top Layer w0.254: U1.99 96.83,33.91 102.8,27.94 112.27,27.94 H68.1
PC10: length 25.4
  Top Layer w0.254: H10.3 124.46,32.64 123.06,34.04 118.49,34.04 114.05,38.48 109.35,38.48 105.92,41.91 U1.111
PC11: length 28.4
  Top Layer w0.254: H10.4 127.51,33.02 126.62,33.91 124.59,33.91 123.7,34.8 118.75,34.8 114.43,39.12 109.98,39.12 106.69,42.41 U1.112
PC12: length 37
  Top Layer w0.254: H11.3 131.06,36.7 128.91,34.54 124.84,34.54 123.82,35.56 119,35.56 114.81,39.75 110.49,39.75 107.33,42.91 U1.113
PC13: length 19.4
  Top Layer w0.254: U1.7 98.33,70.27 103.26,75.2 H55.2
PD0: length 23.8
  Top Layer w0.254: U1.114 107.85,43.41 110.87,40.39 115.32,40.39 119.13,36.58 124.2,36.58 KEY1.1
PD1: length 22.7
  Top Layer w0.254: KEY2.1 124.08,39.88 116.97,39.88 115.7,41.15 111.12,41.15 108.37,43.91 U1.115
PD2: length 35.2
  Top Layer w0.254: U1.116 108.75,44.41 111.51,41.66 116.21,41.66 116.97,40.89 123.06,40.89 123.57,41.4 133.86,41.4 H11.4
PD3: length 21.7
  Top Layer w0.254: U1.117 109.78,44.91 111.38,43.31 124.08,43.31 KEY3.1
PD4: length 22.8
  Top Layer w0.254: KEY4.1 123,45.78 119.44,45.78 117.73,44.07 111.89,44.07 110.55,45.41 U1.118
PD5: length 18.7
  Top Layer w0.254: H12.3 120.27,46.74 119.13,46.74 117.22,44.83 112.65,44.83 111.57,45.91 U1.119
PD6: length 18.2
  Top Layer w0.254: H12.4 119.38,48.39 112.78,48.39 111.8,47.41 U1.122
PD7: length 36.5
  Top Layer w0.254: U1.123 111.41,47.91 112.4,48.9 117.6,48.9 119.63,50.93 127,50.93 130.18,47.75 130.18,45.59 131.52,44.25 SW1.3
PD8: length 37.2
  Top Layer w0.254: H8.3 68.96,10.29 70.87,12.19 72.01,12.19 78.74,18.92 78.74,29.85 85.83,36.94 U1.77
PD9: length 35.7
  Top Layer w0.254: H8.4 71.5,10.67 79.38,18.54 79.38,29.59 86.33,36.55 U1.78
PD10: length 39.7
  Top Layer w0.254: U1.79 86.83,36.29 79.88,29.34 79.88,17.65 73.03,10.8 73.03,8.76 70.74,6.48 JP5.5
PD11: length 38.8
  Top Layer w0.254: 73.28,5.84 74.04,6.6 74.04,10.29 80.52,16.76 80.52,29.08 87.33,35.9 U1.80
PD12: length 38
  Top Layer w0.254: U1.81 87.83,35.38 81.15,28.7 81.15,16.26 75.82,10.92 75.82,5.84
PD13: length 35.4
  Top Layer w0.254: U1.82 88.33,34.74 81.91,28.32 81.91,16 77.98,12.06 77.98,10.3 H52.2
PD14: length 34.5
  Top Layer w0.254: H45.2 81.28,9.95 81.28,13.21 82.8,14.73 82.8,23.24 89.83,30.27 U1.85
PD15: length 33.6
  Top Layer w0.254: U1.86 90.33,29.75 84.33,23.75 84.33,9.4 85.2,8.52 H47.2
PDR: length 32.8
  Top Layer w0.254: U1.143 108.07,57.91 108.97,58.8 R7.1 115.58,61.1 119.25,64.77 119.25,67.06 119.07,67.24 111.69,67.24 H4.1
PE2: length 29
  Top Layer w0.254: H54.2 122.31,75.2 120.78,73.66 120.78,71.5 117.98,68.71 108.84,68.71 101.35,61.21 101.35,60.47 U1.1
PE3: length 26.4
  Top Layer w0.254: H56.2 117.73,73.73 117.73,71.63 115.82,69.72 108.84,69.72 100.83,61.72 U1.2
PE4: length 23.7
  Top Layer w0.254: U1.3 100.33,61.98 108.84,70.49 113.16,70.49 114.17,71.5 114.17,73.5 H60.2
PE5: length 21.1
  Top Layer w0.254: U1.4 99.83,62.37 108.71,71.25 110.49,71.25 111,71.76 111,73.79 112.41,75.2 H57.2
PE6: length 20.9
  Top Layer w0.254: H53.2 108.05,74.04 104.65,74.04 101.6,70.99 101.6,65.02 100.3,63.72 100.3,63.55 100.13,63.39 99.97,63.39 99.33,62.76 U1.5
PE7: length 21.1
  Top Layer w0.254: R44.1 61.33,49.02 64.26,49.02 65.38,47.91 U1.58
PE8: length 21.3
  Top Layer w0.254: U1.59 65.44,47.41 63.5,45.47 R43.1
PE9: length 37.4
  Top Layer w0.254: H27.1 55.75,25.27 67.94,37.47 67.94,41.31 73.55,46.91 U1.60
PE11: length 31.2
  Top Layer w0.254: H61.1 59.51,26.45 77.97,44.91 U1.64
PE13: length 28.4
  Top Layer w0.254: U1.66 78.45,43.91 63.27,28.73 H64.1
PE14: length 25.8
  Top Layer w0.254: U1.67 79.35,43.41 67.03,31.09 H65.1
PF9: length 40.6
  Top Layer w0.254: JP4.1 80.9,78.11 94.87,78.11 95.76,77.22 95.76,67.69 91.33,63.27 U1.21
PF10: length 40.2
  Top Layer w0.254: U1.22 90.83,63.66 95.25,68.07 95.25,76.71 94.65,77.31 87.05,77.31 86.96,77.22 82.55,77.22 JP4.2
PF12: length 26.6
  Top Layer w0.254: U1.50 81.75,51.94 78.36,51.94 76.58,53.72 72.9,53.72 64.39,62.23 61.47,62.23 H42.5
PF13: length 29.8
  Top Layer w0.254: H42.4 58.8,59.56 66.29,59.56 67.64,58.22 67.64,56.06 73.29,50.41 U1.53
PF14: length 32.9
  Top Layer w0.254: U1.54 72.78,49.91 69.09,53.59 64.77,53.59 63.7,54.66 63.7,56.95 61.59,59.06 55.75,59.06 55.32,59.49 55.32,60.12 54.99,60.45
PF15: length 28.1
  Top Layer w0.254: R15.2 U5.5 61.59,58.17 63.12,56.64 63.12,54.1 64.39,52.83 68.33,52.83 71.75,49.41 U1.55
PG0: length 27.9
  Top Layer w0.254: R16.2 60.29,56.52 U5.6 61.47,56.9 62.48,55.88 62.48,53.34 63.63,52.2 67.56,52.2 70.85,48.91 U1.56
PG1: length 18.7
  Top Layer w0.254: R45.1 67.31,51.18 70.08,48.41 U1.57
PG2: length 32.4
  Top Layer w0.254: U1.87 90.83,27.97 87.25,24.38 87.25,9.87 H46.2
PG3: length 31.4
  Top Layer w0.254: H51.2 90.17,9.9 90.17,23.88 91.33,25.04 U1.88
PG4: length 31.4
  Top Layer w0.254: U1.89 91.83,13.58 92.84,12.57 92.84,10.18 H59.2
PG5: length 33
  Top Layer w0.254: U1.90 92.33,19.17 96.27,15.24 96.27,8.76 96.51,8.52 H44.2
PG6: length 33.6
  Top Layer w0.254: U1.91 92.79,38.81 92.79,19.99 98.57,14.21 98.57,11.9 98.6,11.87 98.6,10.18 100.26,8.52 H49.2
PG7: length 34.8
  Top Layer w0.254: U1.92 93.33,21.22 101.85,12.7 101.85,9.4 102.73,8.52 H43.2
PG8: length 35.5
  Top Layer w0.254: U1.93 93.83,23.77 104.78,12.83 104.78,10.03 H50.2
PG9: length 34.3
  Top Layer w0.254: U1.124 111.02,48.41 112.01,49.4 116.97,49.4 119,51.44 128.52,51.44 132.91,47.05 134.58,47.05
PG10: length 33.1
  Top Layer w0.254: SW1.1 133.26,52.07 118.49,52.07 116.33,49.91 111.76,49.91 110.76,48.91 U1.125
PG11: length 46.1
  Top Layer w0.254: U1.126 110.37,49.41 111.38,50.42 115.95,50.42 118.49,52.96 135.76,52.96 141.67,47.05 145.58,47.05
PG12: length 45
  Top Layer w0.254: U1.127 109.98,49.91 111.12,51.05 115.7,51.05 118.36,53.72 137.29,53.72 140.26,50.75 SW1.6
SERVO_5V: length 63.3
  Top Layer w0.508: v1(131.95,57.66) v1(136.02,57.66)
  Bottom Layer w0.508: v1(131.95,57.66) 118.87,57.66 116.97,55.75 116.97,45.85 113.16,42.04 113.16,35.56 107.31,29.72 107.31,24.77 ; H66.2 139.32,54.1 137.92,54.1 136.02,56.01 v1(136.02,57.66)
SWCLK: length 25
  Top Layer w0.254: H5.2 122.43,29.85 121.28,30.99 117.73,30.99 116.59,32.13 116.59,33.91 115.32,35.18 109.11,35.18 U1.109
SWDIO: length 35.4
  Top Layer w0.254: U1.105 99.83,34.79 101.47,33.15 107.31,33.15 108.59,34.42 115.44,34.42 115.57,34.29 115.57,31.12 118.49,28.19 123.82,28.19 124.97,29.34 H5.3
VC1: length 4.5
  Top Layer w0.254: U1.71 80.78,41.41 79.76,40.39 79.76,38.55 C24.2
VC2: length 5.2
  Top Layer w0.254: C25.2 101.35,34.8 100.33,35.81 U1.106
VOUT3.3: length 3.5
  Top Layer w0.254: F3.1 40.95,23.28 R41.2
$1N109: length 1.8
  Top Layer w0.254: LED2.1 112.63,33.28 R13.2
$1N110: length 1.8
  Top Layer w0.254: LED1.1 112.7,31.25 R12.2
$1N111: length 1.7
  Top Layer w0.254: LED3.1 112.45,37.08 R14.2
$1N4086: length 2.2
  Top Layer w0.254: R41.1 40.77,21.59 POWER1.2
$1N7591: length 3.8
  Top Layer w0.508: U4.2 54.4,47.32 Q1.3
$1N7596: length 4
  Top Layer w0.508: Q2.3 55.36,49.78 54.48,48.9 52.07,48.9 U4.4
$1N7602: length 7.4
  Top Layer w0.508: U4.6 55.29,50.72 56.64,52.07 Q3.3
$1N7608: length 2.2
  Top Layer w0.508: Q1.1 59.64,45.41 59.83,45.59
$1N7612: length 2.1
  Top Layer w0.508: Q2.1 59.63,48.96 R44.2
$1N7617: length 1.7
  Top Layer w0.508: R45.2 62.69,51.12 Q3.1

## Copper pours and planes (outline as drawn; the poured copper is in the pictures)
5V on Top Layer: 14.86,36.83 21.97,36.83 21.97,33.15 14.86,33.15
5V on Top Layer: 19.14,36.77 23.76,36.77 23.76,23.11 19.14,23.11
5V on Top Layer: 77.6,7.47 108.08,7.47 108.08,4.45 77.6,4.45
5V on Top Layer: 78.74,4.45 87,4.45 87,2.67 78.74,2.67
5V on Top Layer: 17.21,55.25 29.59,55.25 29.59,36.83 17.21,36.83
5V on Bottom Layer: 104.63,79.01 123.95,79.01 123.95,76.84 104.63,76.84
GND on Top Layer: 0,84.71 0,1.14 0.64,0.51 152.27,0.51 152.27,84.58 0.13,84.58
GND on Top Layer: 23.75,24.64 26.54,24.64 26.54,21.08 23.75,21.08
GND on Top Layer: 19.56,24.38 38.23,24.38 38.23,18.8 19.56,18.8
GND on Top Layer: 9.53,23.37 20.39,23.37 20.39,18.8 9.53,18.8
GND on Top Layer: 40.39,41.15 62.48,41.15 62.48,36.05 40.39,36.05
GND on Top Layer: 54.86,17.15 57.15,17.15 57.15,14.86 54.86,14.86
GND on Top Layer: 17.69,18.8 41.78,18.8 41.78,11.56 17.69,11.56
GND on Bottom Layer: 88.74,78.11 86.47,75.84 86.47,61.98 88.83,59.61 92.38,59.61 95.88,63.12 95.88,76.68 94.46,78.11
GND on Bottom Layer: 104.27,73.74 136.65,73.74 136.65,70.87 104.27,70.87
GND on Bottom Layer: 0.25,84.33 0.25,1.4 0.64,1.02 150.75,1.02 151.38,1.65 151.38,84.33
GND on Bottom Layer: 111,70.96 113.63,70.96 113.63,64.14 111,64.14
GND on Bottom Layer: 107.03,12.33 114.91,12.33 114.91,9.79 107.03,9.79
GND on Bottom Layer: 67.58,18.8 81.01,18.8 81.01,9.65 67.58,9.65
GND on Bottom Layer: 60.96,19.11 68.96,19.11 68.96,16 60.96,16
GND on Bottom Layer: 38.73,19.23 60.98,19.23 60.98,13.84 38.73,13.84
GND on Bottom Layer: 98.69,22.73 114.91,22.73 114.91,12.06 98.69,12.06
GND on Bottom Layer: 35.05,18.03 40,18.03 40,12.83 35.05,12.83
GND on Bottom Layer: 52.45,31.88 57.91,31.88 57.91,19.05 52.45,19.05
GND on Bottom Layer: 51.94,41.15 54.74,41.15 54.74,27.94 51.94,27.94
GND on Bottom Layer: 78.23,12.33 107.53,12.33 107.53,9.79 78.23,9.79
GND on Bottom Layer: 53.66,21.08 75.69,21.08 75.69,19.05 53.66,19.05
GND on Bottom Layer: 16.37,24.32 26.67,24.32 26.67,21.08 16.37,21.08
VDD on Top Layer: 49.29,28.99 52.07,28.99 52.07,25.53 49.29,25.53
VDD on Bottom Layer: 29.08,31.88 52.07,31.88 52.07,9.78 29.08,9.78
VDD3.3 on Top Layer: 66.42,45.85 70.21,45.85 70.21,43.8 66.42,43.8
VDD3.3 on Bottom Layer: 67.94,45.86 70.23,45.86 70.23,43.8 67.94,43.8
IN on Top Layer: 9.65,37.47 12.7,37.47 12.7,24.13 9.65,24.13
SERVO_5V on Top Layer: 47.24,23.62 75.69,23.62 75.69,21.08 47.24,21.08
SERVO_5V on Bottom Layer: 65.53,25.15 114.91,25.15 114.91,21.34 65.53,21.34
TOP_5V on Top Layer: 36.96,36.07 51.18,36.07 51.18,33.55 36.96,33.55
VOUT3.3 on Top Layer: 28.24,27.05 32.98,27.05 32.98,25.02 28.24,25.02
VOUT3.3 on Top Layer: 32.91,28.32 41.66,28.32 41.66,25.01 32.91,25.01
$1N1986 on Top Layer: 42.29,19.56 51.82,19.56 51.82,11.31 42.29,11.31
$1N2157 on Top Layer: 24.39,36.71 30.11,36.71 30.11,33.29 24.39,33.29
$1N2561 on Top Layer: 48.62,38.23 56.96,38.23 56.96,34.67 48.62,34.67
$1N2561 on Top Layer: 54.62,38.99 67.06,38.99 67.06,34.67 54.62,34.67
$1N3080 on Top Layer: 63.5,44.7 67.03,44.7 67.03,41.28 63.5,41.28
$1N3489 on Top Layer: 23.75,27.04 27.43,27.04 27.43,25.02 23.75,25.02
$1N4169 on Top Layer: 44.07,28.19 48.54,28.19 48.54,24.77 44.07,24.77
$1N7369 on Top Layer: 34.42,48.01 41.25,48.01 41.25,42.55 34.42,42.55
$1N7374 on Top Layer: 34.42,50.55 41.25,50.55 41.25,47.1 34.42,47.1
$1N7380 on Top Layer: 34.42,55.12 41.21,55.12 41.21,50.04 34.42,50.04
